# Altium schematic sheet CurrentSensing.SchDoc
size A4; SheetNumber: 3; SheetTotal: 9
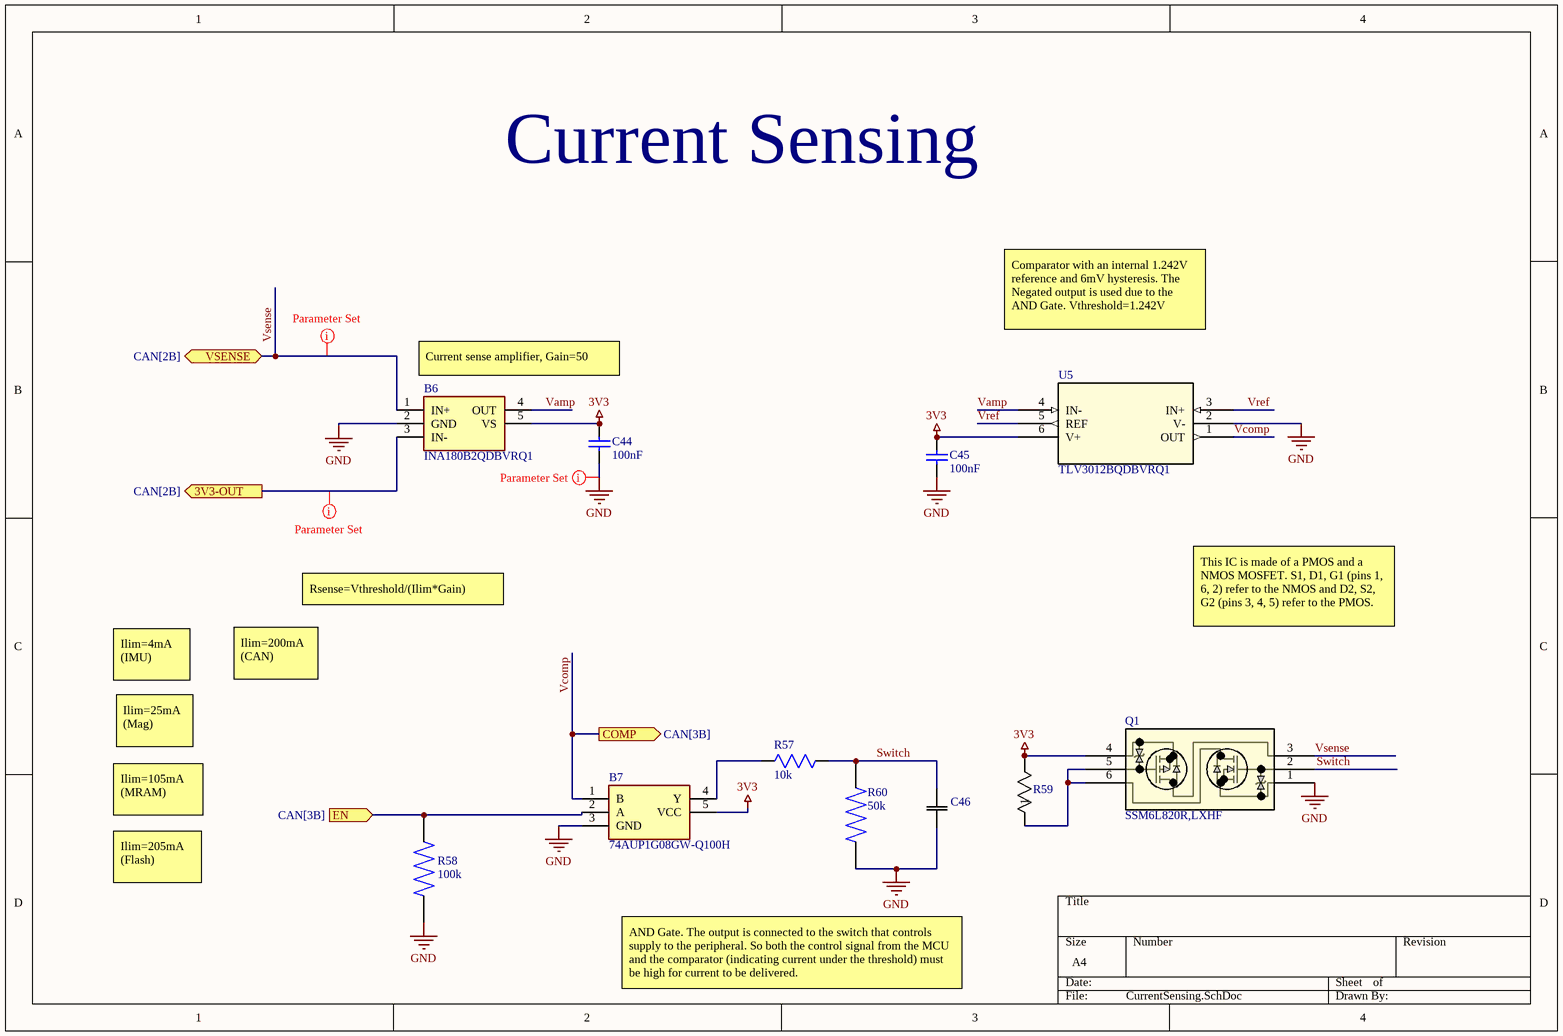
[diagram p0: CurrentSensing.SchDoc]

## Parts
B6  INA180B2QDBVRQ1  [SOT95P280X145-5N]
B7  74AUP1G08GW-Q100H  [SOT65P212X110-5N]
C44  value 100nF  [CAPC1608X87X45LL20T05]  (hidden comment: C0603X104J4RACTU)
C45  value 100nF  [CAPC1608X87X45LL20T05]  (hidden comment: C0603X104J4RACTU)
C46  C0603X103F3GACAUTO  [CAPC17795_95N_KEM]  (value not drawn)
Q1  SSM6L820R,LXHF  [TSOP6F_TOS]
R57  value 10k  [RES_ERA3ARB103V]  (hidden comment: ERA3ARB103V)
R58  value 100k  [RESC1608X50N]  (hidden comment: RG1608N-104-W-T1)
R59  CRCW060310K0DHEAP  [RC0603N_VIS]  (value not drawn)
R60  value 50k  [RESC1608X55N]  (hidden comment: TNPU060350K0HZEN00)
U5  TLV3012BQDBVRQ1  [SOT-23-6_DBV_TEX]

## Ports
3V3-OUT (out, see CAN[2B]), COMP (out, see CAN[3B]), EN (in, see CAN[3B]), VSENSE (bidir, see CAN[2B])

## Nets
3V3: B6.5(VS) B7.5(VCC) C44.1 C45.1 Q1.4 R59.2 U5.6(V+)
GND: B6.2(GND) B7.3(GND) C44.2 C45.2 C46.1 Q1.1 R58.1 R60.1 U5.2(V-)
3V3-OUT: B6.3(IN-) ; port 3V3-OUT
EN: B7.2(A) R58.2 ; port EN
Switch: C46.2 Q1.2 R57.1 R60.2
Vamp: B6.4(OUT) U5.4(IN-)
Vcomp: B7.1(B) U5.1(OUT) ; port COMP
Vref: U5.3(IN+) U5.5(REF)
Vsense: B6.1(IN+) Q1.3 ; port VSENSE
NetB7_4: B7.4(Y) R57.2
NetQ1_5: Q1.5 Q1.6 R59.1

## Layout directives
net class SupplyMin: 3V3-OUT, GND, Vsense

## Notes on the sheet
- Current Sensing
- (near B6) Current sense amplifier, Gain=50
- Comparator with an internal 1.242V reference and 6mV hysteresis. The Negated output is used due to the AND Gate. Vthreshold=1.242V
- Rsense=Vthreshold/(Ilim*Gain)
- This IC is made of a PMOS and a NMOS MOSFET. S1, D1, G1 (pins 1, 6, 2) refer to the NMOS and D2, S2, G2 (pins 3, 4, 5) refer to the PMOS.
- Ilim=4mA (IMU)
- Ilim=200mA (CAN)
- Ilim=25mA (Mag)
- Ilim=105mA (MRAM)
- Ilim=205mA (Flash)
- AND Gate. The output is connected to the switch that controls supply to the peripheral. So both the control signal from the MCU and the comparator (indicating current under the threshold) must be high for current to be delivered.

## Library data of the parts
B6 = CMP-014-00005-3: AEC-Q100, 26-V, low-/high-side, voltage output current sense amplifier; Manufacturer_Name: Texas Instruments; Geometry.Height: 1.45mm; Datasheet Link: http://www.ti.com/lit/gpn/INA180-Q1; Source: INA180B2QDBVRQ1.SchLib; Mouser Price/Stock: https://www.mouser.co.uk/ProductDetail/Texas-Instruments/INA180B2QDBVRQ1?qs=9r4v7xj2Lnm44%2Fgl%2FBjV6g%3D%3D; Manufacturer_Part_Number: INA180B2QDBVRQ1; Mouser Part Number: 595-INA180B2QDBVRQ1; Design Item ID: INA180B2QDBVRQ1
B7 = CMP-218-000000-3: 74AUP1G08-Q100 - Low-power 2-input AND gate@en-us; Manufacturer_Name: Nexperia; Geometry.Height: 1.1mm; Mouser Part Number: 771-74AUP1G08GWQ100H; Manufacturer_Part_Number: 74AUP1G08GW-Q100H; Design Item ID: 74AUP1G08GW-Q100H; Datasheet Link: https://assets.nexperia.com/documents/data-sheet/74AUP1G08_Q100.pdf; Source: 74AUP1G08GW-Q100H.SchLib; Mouser Price/Stock: https://www.mouser.co.uk/ProductDetail/Nexperia/74AUP1G08GW-Q100H?qs=5XOdhvmYM0Mwp8ByWVd8CQ%3D%3D
C44 C45 = CMP-001-00103-1: Multilayer Ceramic Capacitors MLCC - SMD/SMT 16V 0.1uF X7R 0603 5% Flex Soft; Dissipation Factor: 3.5%; Termination: SMD/SMT; Schedule B: 8532240020, 8532240020; Voltage Rating (DC): 16V; Case/Package: 0603; Width: 800µm; Mounting Technology: Surface Mount; Lifecycle Status: Production; RoHS: Compliant; Dielectric Material: Ceramic; Max Operating Temperature: 125°C; Voltage: 16V; China RoHS: Compliant; Dielectric: X7R; REACH SVHC: Yes; Voltage Rating: 16V; Min Operating Temperature: -55°C; Case Code (Imperial): 0603; Number of Terminals: 2; Case Code (Metric): 1608; Length: 1.6mm; Features: Soft Termination; Tolerance: 5%; Thickness: 863.6µm; Depth: 800µm; Height: 800µm
C46 = CMP-001-00116-2: SMD Auto C0G Flex, Ceramic, 0.01 uF, 1%, 25 VDC, C0G, SMD, MLCC, FT-CAP, Ultra-Stable, Automotive Grade, 0603; Manufacturer_Name: Kemet; Copyright: Copyright (C) 2025 Ultra Librarian. All rights reserved.; Design Item ID: C0603X103F3GACAUTO; Manufacturer_Part_Number: C0603X103F3GACAUTO; Source: C0603X103F3GACAUTO.SchLib
Q1 = CMP-382-000000-1: N-ch + P-ch MOSFET, 30 V/-20 V, 4 A/-4 A, 0.0391 Î©@4.5V/0.045 Î©@10V, TSOP6F; Manufacturer_Name: Toshiba Electronic Devices & Storage Corp.; Datasheet: https://toshiba.semicon-storage.com/info/docget.jsp?did=63678&prodName=SSM6L820R; Type: Type; Design Item ID: SSM6L820R,LXHF; Copyright: Copyright (C) 2026 Ultra Librarian. All rights reserved.; RefDes: RefDes; Manufacturer_Part_Number: SSM6L820R,LXHF; Source: SSM6L820R,LXHF.SchLib
R57 = CMP-009-00245-3: Thin Film Resistors - SMD 0603 10Kohm 0.1% 10ppm AEC-Q200; Design Item ID: ERA3ARB103V; Case/Package: None; Pins: 2; Source: ERA3ARB103V.SchLib; Component Type: Standard; MP: ERA3ARB103V; Availability: Unavailable; Price: None
R58 = CMP-009-00274-1: 100 kOhms Â±0.05% 0.1W, 1/10W Chip Resistor 0603 (1608 Metric) Anti-Sulfur, Automotive AEC-Q200 Thin Film; MF: Susumu; Pins: 2; Case/Package: 1608 Susumu; Design Item ID: RG1608N-104-W-T1; Component Type: Standard; MP: RG1608N-104-W-T1; Check_prices: https://www.snapeda.com/parts/RG1608N-104-W-T1/Susumu/view-part/?ref=eda; SnapEDA_Link: https://www.snapeda.com/parts/RG1608N-104-W-T1/Susumu/view-part/?ref=snap; Source: RG1608N-104-W-T1.SchLib
R59 = CMP-009-00226-2: D11/CRCW0603-P 50 10K 0.5% ET1 e3; Manufacturer_Name: Vishay; Manufacturer_Part_Number: CRCW060310K0DHEAP; Copyright: Copyright (C) 2026 Ultra Librarian. All rights reserved.; Datasheet: https://www.vishay.com/doc?20036; Design Item ID: CRCW060310K0DHEAP; Source: CRCW060310K0DHEAP.SchLib
R60 = CMP-009-00220-1: 50 kOhms Â±0.02% 0.1W, 1/10W Chip Resistor 0603 (1608 Metric) Anti-Sulfur, Automotive AEC-Q200, Moisture Resistant Thin Film; MF: Vishay; Check_prices: https://www.snapeda.com/parts/TNPU060350K0HZEN00/Vishay/view-part/?ref=eda; SnapEDA_Link: https://www.snapeda.com/parts/TNPU060350K0HZEN00/Vishay/view-part/?ref=snap; Component Type: Standard; Design Item ID: TNPU060350K0HZEN00; Source: TNPU060350K0HZEN00.SchLib; MP: TNPU060350K0HZEN00; Case/Package: 1608 Vishay; Pins: 2
U5 = CMP-031-00019-1: Automotive micropower comparator with integrated reference pin and push-pull output 6-SOT-23 -40 to 125; Manufacturer_Name: Texas Instruments; Datasheet: https://www.ti.com/lit/gpn/tlv3012b-q1; Design Item ID: TLV3012BQDBVRQ1; Copyright: Copyright (C) 2026 Ultra Librarian. All rights reserved.; Manufacturer_Part_Number: TLV3012BQDBVRQ1; Type: Linear; RefDes: RefDes; Source: TLV3012BQDBVRQ1.SchLib